# Altium project Breakout_Board.PrjPcb
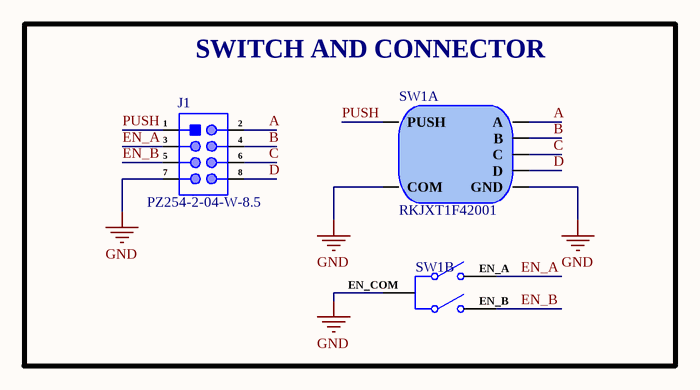
[diagram p0: Switch_Sheet.SchDoc]
1 sheet, 2 parts. Net scope: global (net labels, ports and power ports of the same name join across sheets).
Board file: Breakout_Board.PcbDoc

## Sheet Switch_Sheet.SchDoc
size A4; SheetNumber: 1; SheetTotal: 1

### Parts
J1  PZ254-2-04-W-8.5  [PZ254-2-04-W-8.5]
SW1  RKJXT1F42001  [RKJXT1F42001]  (parts A,B of 2)

### Blocks framed on the sheet
SWITCH AND CONNECTOR: J1 SW1

### Nets
GND: J1.7 SW1.COM SW1.EN_COM SW1.GND
A: J1.2 SW1.A
B: J1.4 SW1.B
C: J1.6 SW1.C
D: J1.8 SW1.D
EN_A: J1.3 SW1.EN_A
EN_B: J1.5 SW1.EN_B
PUSH: J1.1 SW1.PUSH

### Notes on the sheet
- File:
- Title:
- Date:
- Page
- Num:
- Total:
- Drawn By: Huzaifa Ali

### Library data of the parts
J1 = PZ254-2-04-W-8.5: 3A Right-Angle Square Pins 2.5mm 260℃@10S 8P 6mm -40℃~+105℃ 2.54mm 双排 Black 2.54mm 2x4P Push-Pull,P=2.54mm Pin Headers ROHS; Manufacturer: HCTL; Manufacturer Part Number: PZ254-2-04-W-8.5; LCSC Part No: C2894984; ComponentLink1URL: https://www.lcsc.com/product-detail/Pin-Headers_HCTL-PZ254-2-04-W-8-5_C2894984.html; ComponentLink1Description: LCSC; Item Type: Push-Pull,P=2.54mm
SW1 = RKJXT1F42001: Electromechanical Switch 4-Directional Stick Switch 0.01A Bulk; Manufacturer: Alps Alpine; Manufacturer Part Number: RKJXT1F42001; Item Type: Switch; Supplier: Mouser; Supplier Part Number: 688-RKJXT1F42001; RoHS: Yes; Category: Pushbutton Switches; Stock: 1987; Pricing: 1=8.44, 10=7.1, 25=6.33, 50=6.33, 100=5.99, 250=5.75, 1000=5.75, 10000=5.75 (USD); ComponentLink1URL: https://datasheet.ciiva.com/16197/rkjxt-16197381.pdf?src-supplier=Onlinecomponents.com; ComponentLink1Description: https://datasheet.ciiva.com/16197/rkjxt-16197381.pdf?src-supplier=Onlinecomponents.com